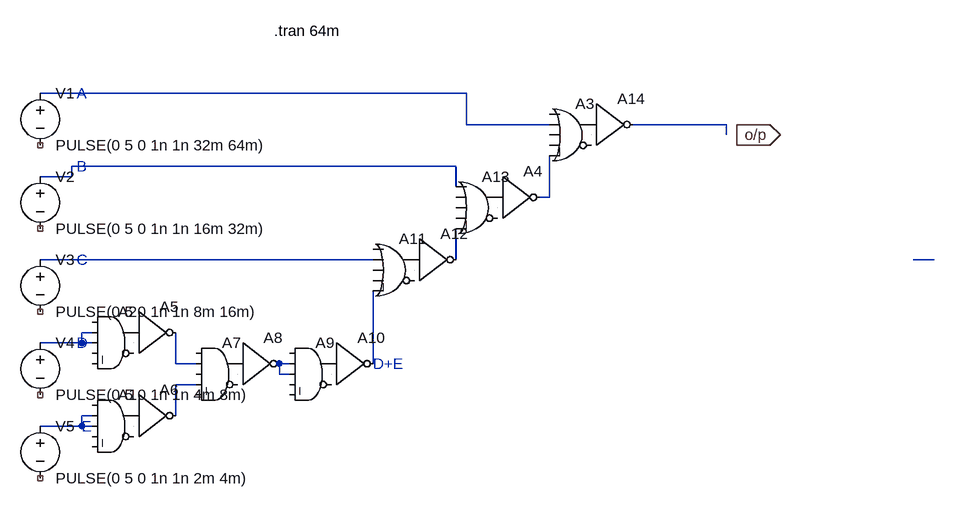
[diagram p0: schematic 12c.asc]
12c.asc, the LTspice schematic file:
Version 4.1
SHEET 1 1700 736
WIRE 720 -16 64 -16
WIRE 720 32 720 -16
WIRE 848 32 720 32
WIRE 1120 32 976 32
WIRE 1120 48 1120 32
WIRE 704 96 112 96
WIRE 112 112 112 96
WIRE 112 112 64 112
WIRE 704 128 704 96
WIRE 848 144 848 80
WIRE 848 144 832 144
WIRE 576 240 64 240
WIRE 704 240 704 192
WIRE 1440 240 1408 240
WIRE 144 352 128 352
WIRE 128 368 128 352
WIRE 128 368 64 368
WIRE 144 368 128 368
WIRE 272 400 272 352
WIRE 304 400 272 400
WIRE 448 400 432 400
WIRE 576 400 576 288
WIRE 432 416 432 400
WIRE 448 416 432 416
WIRE 304 432 272 432
WIRE 144 480 128 480
WIRE 272 480 272 432
WIRE 128 496 128 480
WIRE 128 496 64 496
WIRE 144 496 128 496
FLAG 1136 48 o/p
IOPIN 1136 48 Out
SYMBOL voltage 64 -32 R0
WINDOW 123 0 0 Left 0
WINDOW 39 0 0 Left 0
SYMATTR InstName V1
SYMATTR Value PULSE(0 5 0 1n 1n 32m 64m)
SYMBOL voltage 64 96 R0
WINDOW 123 0 0 Left 0
WINDOW 39 0 0 Left 0
SYMATTR InstName V2
SYMATTR Value PULSE(0 5 0 1n 1n 16m 32m)
SYMBOL voltage 64 224 R0
WINDOW 123 0 0 Left 0
WINDOW 39 0 0 Left 0
SYMATTR InstName V3
SYMATTR Value PULSE(0 5 0 1n 1n 8m 16m)
SYMBOL voltage 64 352 R0
WINDOW 123 0 0 Left 0
WINDOW 39 0 0 Left 0
SYMATTR InstName V4
SYMATTR Value PULSE(0 5 0 1n 1n 4m 8m)
SYMBOL voltage 64 480 R0
WINDOW 123 0 0 Left 0
WINDOW 39 0 0 Left 0
SYMATTR InstName V5
SYMATTR Value PULSE(0 5 0 1n 1n 2m 4m)
SYMBOL Digital\\and 176 432 R0
SYMATTR InstName A1
SYMBOL Digital\\and 176 304 R0
SYMATTR InstName A2
SYMBOL Digital\\inv 208 288 R0
SYMATTR InstName A5
SYMBOL Digital\\inv 208 416 R0
SYMATTR InstName A6
SYMBOL Digital\\and 336 352 R0
SYMATTR InstName A7
SYMBOL Digital\\inv 368 336 R0
SYMATTR InstName A8
SYMBOL Digital\\and 480 352 R0
SYMATTR InstName A9
SYMBOL Digital\\inv 512 336 R0
SYMATTR InstName A10
SYMBOL Digital\\or 608 192 R0
SYMATTR InstName A11
SYMBOL Digital\\inv 640 176 R0
SYMATTR InstName A12
SYMBOL Digital\\or 736 96 R0
SYMATTR InstName A13
SYMBOL Digital\\inv 768 80 R0
SYMATTR InstName A4
SYMBOL Digital\\or 880 -16 R0
SYMATTR InstName A3
SYMBOL Digital\\inv 912 -32 R0
SYMATTR InstName A14
TEXT 424 -112 Left 2 !.tran 64m
TEXT 120 -16 Left 2 ;A
TEXT 120 96 Left 2 ;B
TEXT 120 240 Left 2 ;C
TEXT 120 368 Left 2 ;D
TEXT 128 496 Left 2 ;E
TEXT 576 400 Left 2 ;D+E

The netlist it stands for:
* 12c.asc
V1 N001 NC_01 PULSE(0 5 0 1n 1n 32m 64m)
V2 N003 NC_02 PULSE(0 5 0 1n 1n 16m 32m)
V3 N005 NC_03 PULSE(0 5 0 1n 1n 8m 16m)
V4 N008 NC_04 PULSE(0 5 0 1n 1n 4m 8m)
V5 N013 NC_05 PULSE(0 5 0 1n 1n 2m 4m)
A1 0 N013 N013 0 0 0 P001 0 AND
A2 0 N008 N008 0 0 0 P002 0 AND
A5 P002 0 0 0 0 N009 0 0 BUF
A6 P001 0 0 0 0 N012 0 0 BUF
A7 0 N009 0 N012 0 0 P003 0 AND
A8 P003 0 0 0 0 N010 0 0 BUF
A9 0 N010 N010 0 0 0 P004 0 AND
A10 P004 0 0 0 0 N011 0 0 BUF
A11 0 N005 0 0 N011 0 P005 0 OR
A12 P005 0 0 0 0 N006 0 0 BUF
A13 N003 0 0 0 N006 0 P006 0 OR
A4 P006 0 0 0 0 N004 0 0 BUF
A3 0 N001 0 0 N004 0 P007 0 OR
A14 P007 0 0 0 0 N002 0 0 BUF
.tran 64m
* A
* B
* C
* D
* E
* D+E
.backanno
.end